# Altium schematic sheet Power.SchDoc
size A3; SheetNumber: 3; SheetTotal: 7
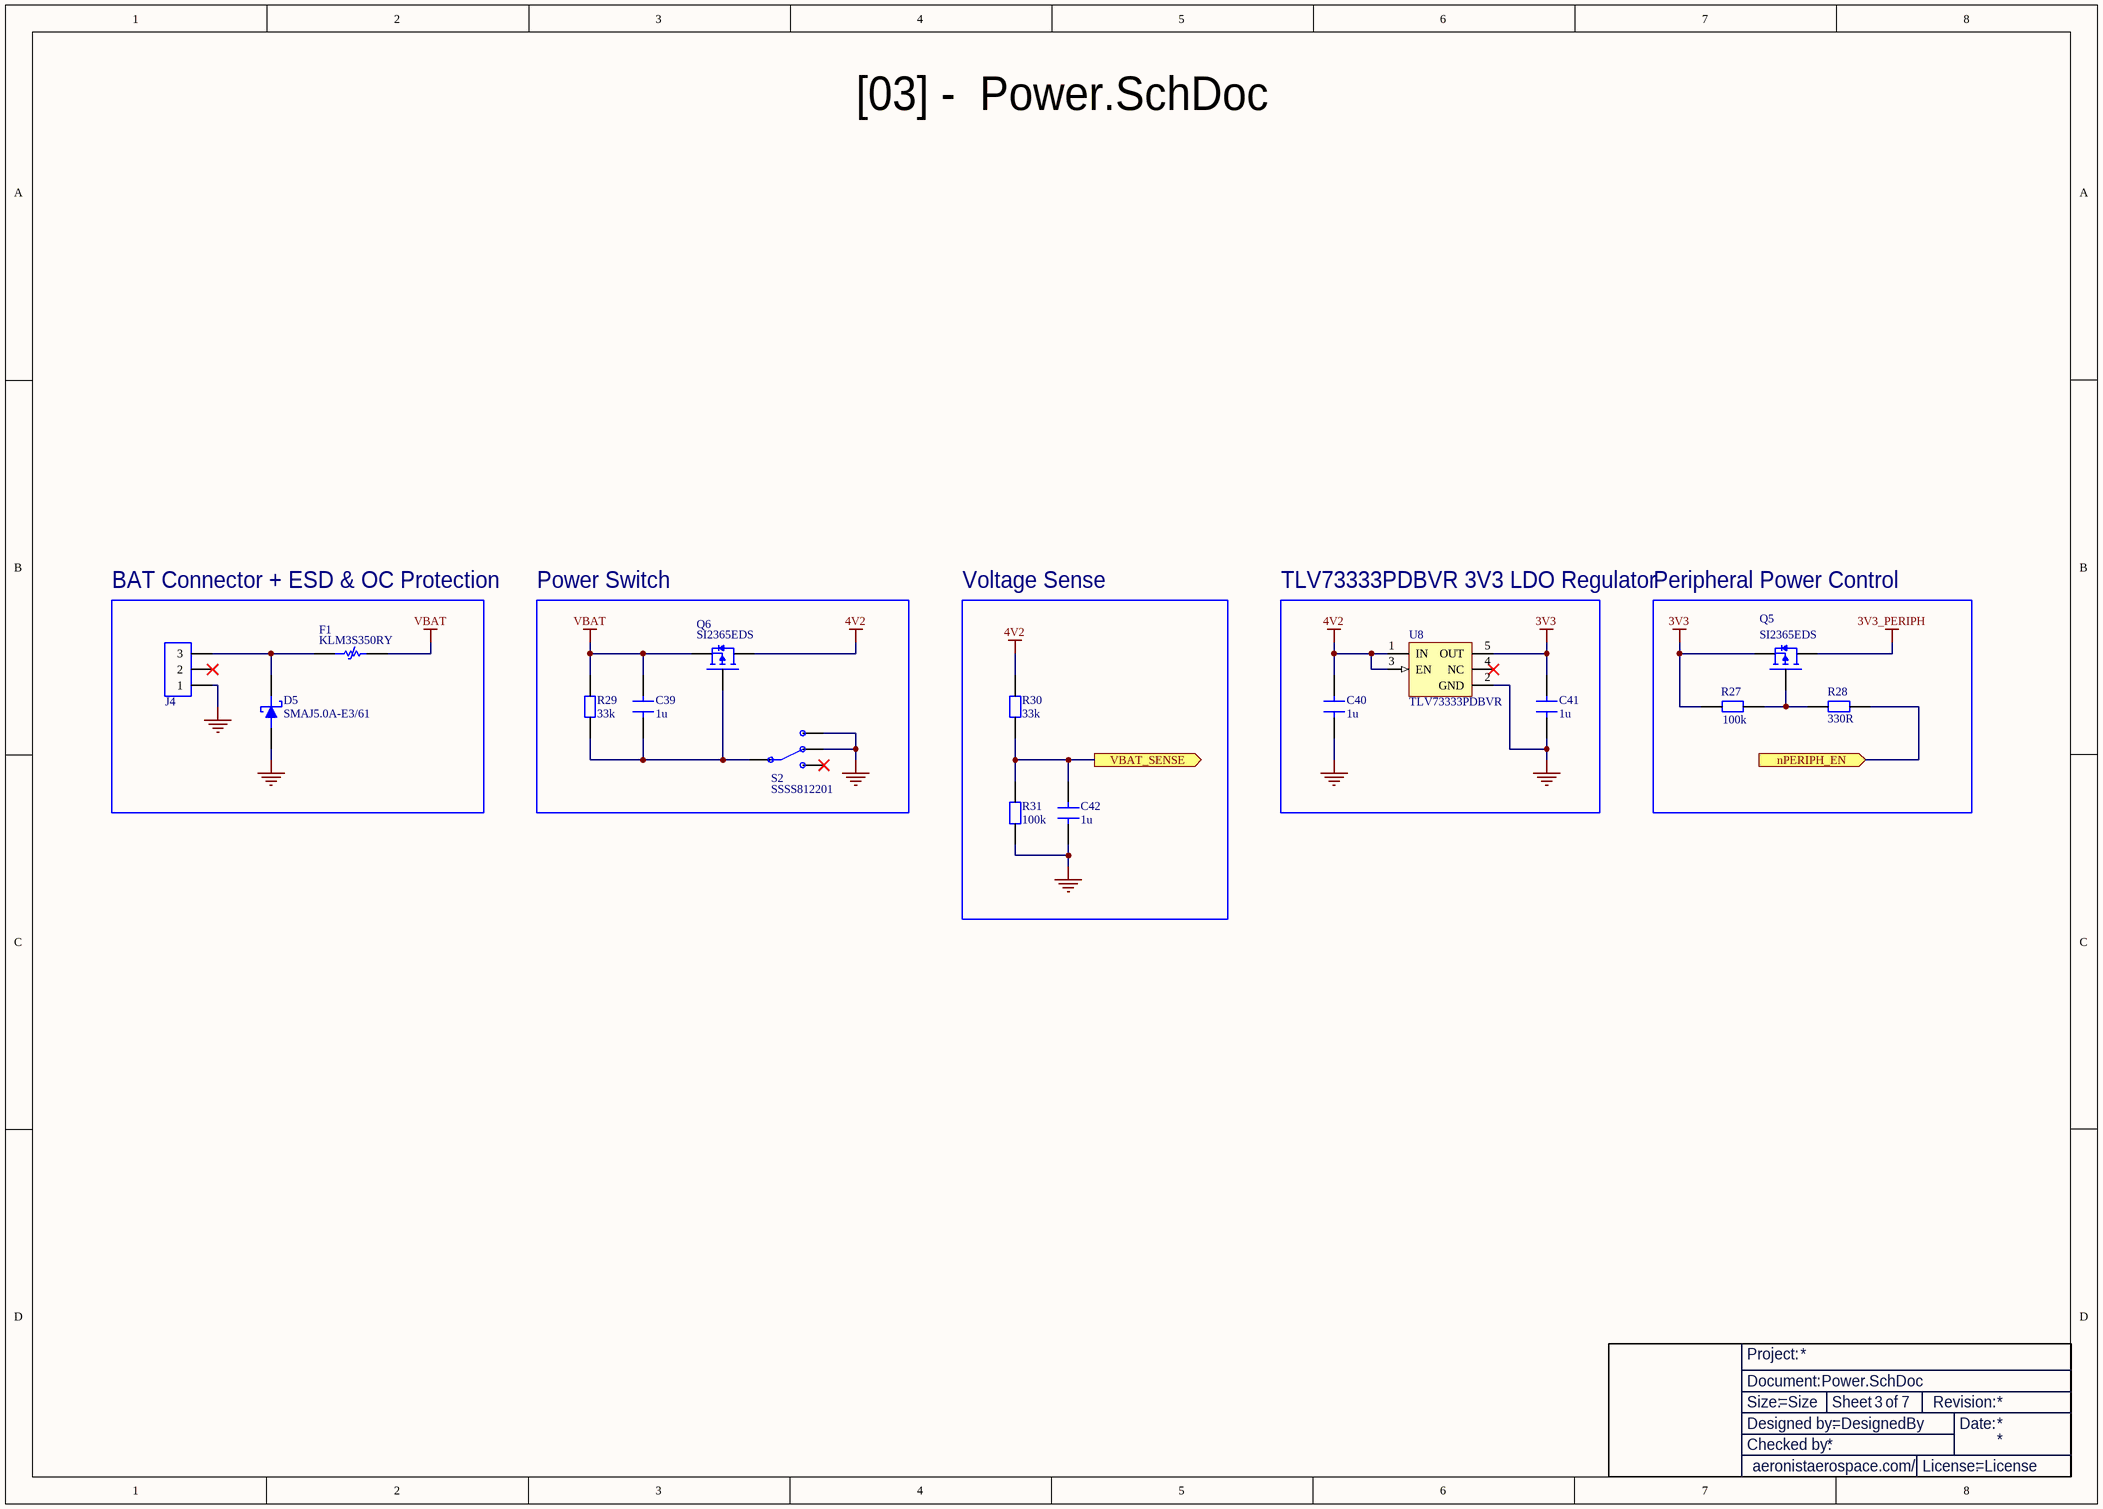
[diagram p0: Power.SchDoc]

## Parts
?  Title Block  (value not drawn)  (graphical)
C39  1u  [CAP 0603]
C40  1u  [CAP 0603]
C41  1u  [CAP 0603]
C42  1u  [CAP 0603]
D5  SMAJ5.0A-E3/61  [SMA]
F1  KLM3S350RY  [PTC 1206]
J4  CONN 1x3 Micro Fit 3.00mm  [CONN 1X3 MICRO-FIT 3.00MM]  (value not drawn)
Q5  SI2365EDS  [SOT23-3]
Q6  SI2365EDS  [SOT23-3]
R27  100k  [RES 0402]
R28  330R  [RES 0402]
R29  33k  [RES 0402]
R30  33k  [RES 0402]
R31  100k  [RES 0402]
S2  SSSS812201  [SSSS812201]
U8  TLV73333PDBVR  [SOT23-5]

## Blocks framed on the sheet
BAT Connector + ESD & OC Protection: D5 F1 J4
Power Switch: C39 Q6 R29 S2
Voltage Sense: C42 R30 R31
TLV73333PDBVR 3V3 LDO Regulator: C40 C41 U8
Peripheral Power Control: Q5 R27 R28

## Ports
nPERIPH_EN (in, see MCU[4B]), VBAT_SENSE (out, see MCU[4C])

## Nets
3V3: C41.2 Q5.2(S) R27.2 U8.5(OUT)
3V3_PERIPH: Q5.3(D)
4V2: C40.2 Q6.3(D) R30.2 U8.1(IN) U8.3(EN)
GND: C40.1 C41.1 C42.1 D5.1 J4.1 R31.1 S2.1(NO) S2.2(NC) U8.2(GND)
VBAT: C39.2 F1.2 Q6.2(S) R29.2
nPERIPH_EN: R28.1 ; port nPERIPH_EN
VBAT_SENSE: C42.2 R30.1 R31.2 ; port VBAT_SENSE
NetC39_1: C39.1 Q6.1(G) R29.1 S2.3(C)
NetD5_2: D5.2 F1.1 J4.3
NetQ5_1: Q5.1(G) R27.1 R28.2

Not connected (* = marked no-connect by the designer): J4 2*; S2 4(NO)*; U8 4(NC)*

## Notes on the sheet
- [03] -  Power.SchDoc
- (in symbol Title Block) Project:; Document:; Size:; Sheet; of; Revision:; Designed by:; Date:; Checked by:; aeronistaerospace.com/; License:

## Library data of the parts
C39-C42 = CAP 0603: Capacitor SMD 0603
D5 = SMAJ-X: SMAJ Series SMT Bi/Uni-Directional Transient Voltage Suppressor - SMA
F1 = PTC 1206: PTC Resettable Fuse; Manufacturer: Bel; Manufacturer Part Number: 0ZCG0075FF2C; Max Current Rating: 100A; Hold Current: 750mA; Trip Current: 1.5A; Time to Trip: 200ms; Supplier 1: Arrow Electronics; RoHS: Yes; Category: PTC Resettable Fuses; Stock 1: 4661; Pricing 1: 2000=0,0751, 4000=0,0699, 6000=0,065, 10000=0,0604 (USD); Mount: Surface Mount; Case/Package: 1812; Case Code (Metric): 4532; Case Code (Imperial): 1812; Contact Plating: Tin,Matte; Min Operating Temperature: -40°C; Max Operating Temperature: 85°C; Packaging: Cut Tape; Series: 0ZCG; Lead Free: Lead Free; RoHS Compliant: Yes; ComponentLink1URL: https://datasheet.ciiva.com/18550/0zcg-18550523.pdf?src-supplier=Digi-Key; ComponentLink1Description: https://datasheet.ciiva.com/18550/0zcg-18550523.pdf?src-supplier=Digi-Key; ComponentLink2URL: https://datasheet.ciiva.com/18550/0zcg-18550524.pdf?src-supplier=Digi-Key; ComponentLink2Description: https://datasheet.ciiva.com/18550/0zcg-18550524.pdf?src-supplier=Digi-Key; ComponentLink3URL: https://datasheet.ciiva.com/18550/0zcg-18550767.pdf?src-supplier=Digi-Key; ComponentLink3Description: https://datasheet.ciiva.com/18550/0zcg-18550767.pdf?src-supplier=Digi-Key
J4 = CONN 1x3 Micro Fit 3.00mm: 1×2 Micro Fit type connector, 3.0 mm pitch, surface-mount.
Q5 Q6 = MOSFET P-CH: SOT-23-3 package, P-Channel MOSFET
R27-R31 = RES 0402: Resistor SMD 0402
S2 = SSSS812201: Slide Switch / Switch Slide SP3T Side Slide 0.3A 5VDC 10000Cycles Gull Wing SMD T/R; Manufacturer: ALPS; Actuator Length: 1.4986mm; Contact Current Rating: 300mA; Contact Resistance: 70mΩ; Electrical Life: 10kcycles; Illumination Type: Non-Illuminated; Insulation Resistance: 100MΩ; Max Voltage Rating (DC): 4V; Number of Positions: 3; Operating Force: 2N; Voltage Rating (DC): 5V; Supplier: Mouser; Supplier Part Number: 688-SSSS812201; Manufacturer Part Number: SSSS812201; RoHS: Compliant; Category: Slide Switches; Stock: 3543; Pricing: 1=1,77, 10=1,6, 50=1,47, 100=1,34, 1000=0,852, 10000=0,851 (USD); Current Rating: 300mA; Depth: 5mm; Export Control Classification Number (ECCN) Code: EAR99; Height: 1.4mm; Harmonized Tariff Schedule (HTS) Code: 8536.50.90.50; Introduction Date: 2010-02-04; Length: 9.7mm; Lifecycle Status: Production; Max Current Rating: 300mA; Max Operating Temperature: 85°C; Mechanical Life: 10kcycles; Min Operating Temperature: -40°C; Mounting Technology: Surface Mount; Pins: 3; Orientation: Right Angle; Radiation Hardening: No; Termination: Gull Wing; Throw Configuration: SP3T; ComponentLink1URL: https://datasheet.octopart.com:443/SSSS812201-ALPS-datasheet-182235029.pdf?src-supplier=IHS; ComponentLink1Description: https://datasheet.octopart.com:443/SSSS812201-ALPS-datasheet-182235029.pdf?src-supplier=IHS; ComponentLink2URL: https://datasheet.octopart.com:443/SSSS812201-ALPS-datasheet-182235643.pdf?src-supplier=IHS; ComponentLink2Description: https://datasheet.octopart.com:443/SSSS812201-ALPS-datasheet-182235643.pdf?src-supplier=IHS; ComponentLink3URL: https://datasheet.octopart.com:443/SSSS812201-ALPS-datasheet-154726925.pdf?src-supplier=Electro+Sonic; ComponentLink3Description: https://datasheet.octopart.com:443/SSSS812201-ALPS-datasheet-154726925.pdf?src-supplier=Electro+Sonic; ComponentLink4URL: https://datasheet.octopart.com:443/SSSS812201-ALPS-datasheet-41175121.pdf?src-supplier=Electro+Sonic; ComponentLink4Description: https://datasheet.octopart.com:443/SSSS812201-ALPS-datasheet-41175121.pdf?src-supplier=Electro+Sonic; ComponentLink5URL: https://datasheet.octopart.com:443/SSSS812201-ALPS-datasheet-37145305.pdf?src-supplier=Electro+Sonic; ComponentLink5Description: https://datasheet.octopart.com:443/SSSS812201-ALPS-datasheet-37145305.pdf?src-supplier=Electro+Sonic; ComponentLink6URL: https://datasheet.octopart.com:443/SSSS812201-ALPS-datasheet-140497758.pdf?src-supplier=TME; ComponentLink6Description: https://datasheet.octopart.com:443/SSSS812201-ALPS-datasheet-140497758.pdf?src-supplier=TME
U8 = TLV73333PDBVR: 300-mA, capacitor-free, low-IQ, low-dropout voltage regulator with enable 5-SOT-23 -40 to 125; Manufacturer: Texas Instruments; Manufacturer Lifecycle Status: ACTIVE; Accuracy: 1%; Dropout Voltage: 125mV; Max Supply Voltage: 5.5V; Max Junction Temperature (Tj): 125°C; Max Output current: 300mA; Min Current Limit: 360mA; Min Input Voltage: 1.4V; Nominal Supply Current: 34µA; Number of Channels: 1; Output Type: Fixed; Output Voltage: 3.3V; Polarity: Positive; Quiescent Current: 60µA; Supplier: Mouser; Supplier Part Number: 595-TLV73333PDBVR; Manufacturer Part Number: TLV73333PDBVR; RoHS: Compliant; Category: LDO Voltage Regulators; Stock: 12067; Pricing: 1=0,17, 10=0,115, 50=0,101, 100=0,086, 1000=0,07, 10000=0,062 (USD); Case/Package: SOT-23; Contact Plating: Gold; Height: 1.45mm; Lead Free: Lead Free; Length: 2.9mm; Lifecycle Status: Production; Max Operating Temperature: 125°C; Min Operating Temperature: -40°C; Min Supply Voltage: 1.4V; Mounting Technology: Surface Mount; Number of Outputs: 1; Pins: 5; Number of Regulators: 1; Output Current: 300mA; Packaging: Tape & Reel; Radiation Hardening: No; Schedule B: 8542390000, 8542390000|8542390000|8542390000|8542390000|8542390000; Thickness: 1.2mm; Weight: 15.790684mg; Width: 1.6mm; ComponentLink1URL: https://sigma.octopart.com:443/177332311/technical_drawing/Texas-Instruments-TLV73333PDBVR.pdf?src-supplier=Texas+Instruments; ComponentLink1Description: https://sigma.octopart.com:443/177332311/technical_drawing/Texas-Instruments-TLV73333PDBVR.pdf?src-supplier=Texas+Instruments; ComponentLink2URL: https://octopart.com:443/opatz8j6/c1?t=30rxbCOKURE0fvLotVHr2--9yC-4hWgg0fjorl7QajC5RXkKBG22M4ZWLOTtqEVkHrkQWGSvUBCT4JzFCKRza57xxEH2AM5zMdrmzUF7HUn0SZ7VrBnq1qaBEhnASKZ9K6cpMGD6K96mHw2RuAXFnqi8r3hf25pr5WVy_93zC9DtrJ2-QNFvwlrZk1EXJAO4qYO9518NXgqDx2DdBm28by8vGuJzgOvU8mXkfRtT8k19nHvP1ZfIaADJPU6FeaqlEbd-j24xmPfxYt-FfVEHWXt0tW1yZYApp5WPtqSvL-aKGKcx1420oXKrzNb7imis-_kE6QqMT633l-x_OdY6nHSWd6_HrFJGfkvfwlphIUbgO9Y3y8pg3cXI5t7uujLqBDPZRvw&src-supplier=Texas+Instruments; ComponentLink2Description: https://octopart.com:443/opatz8j6/c1?t=30rxbCOKURE0fvLotVHr2--9yC-4hWgg0fjorl7QajC5RXkKBG22M4ZWLOTtqEVkHrkQWGSvUBCT4JzFCKRza57xxEH2AM5zMdrmzUF7HUn0SZ7VrBnq1qaBEhnASKZ9K6cpMGD6K96mHw2RuAXFnqi8r3hf25pr5WVy_93zC9DtrJ2-QNFvwlrZk1EXJAO4qYO9518NXgqDx2DdBm28by8vGuJzgOvU8mXkfRtT8k19nHvP1ZfIaADJPU6FeaqlEbd-j24xmPfxYt-FfVEHWXt0tW1yZYApp5WPtqSvL-aKGKcx1420oXKrzNb7imis-_kE6QqMT633l-x_OdY6nHSWd6_HrFJGfkvfwlphIUbgO9Y3y8pg3cXI5t7uujLqBDPZRvw&src-supplier=Texas+Instruments; ComponentLink3URL: https://sigma.octopart.com:443/175570406/technical_drawing/Texas-Instruments-TLV73333PDBVR.pdf?src-supplier=Texas+Instruments; ComponentLink3Description: https://sigma.octopart.com:443/175570406/technical_drawing/Texas-Instruments-TLV73333PDBVR.pdf?src-supplier=Texas+Instruments; ComponentLink4URL: https://sigma.octopart.com:443/169406034/technical_drawing/Texas-Instruments-TLV73333PDBVR.pdf?src-supplier=Texas+Instruments; ComponentLink4Description: https://sigma.octopart.com:443/169406034/technical_drawing/Texas-Instruments-TLV73333PDBVR.pdf?src-supplier=Texas+Instruments; ComponentLink5URL: https://sigma.octopart.com:443/155939316/technical_drawing/Texas-Instruments-TLV73333PDBVR.pdf?src-supplier=Texas+Instruments; ComponentLink5Description: https://sigma.octopart.com:443/155939316/technical_drawing/Texas-Instruments-TLV73333PDBVR.pdf?src-supplier=Texas+Instruments; ComponentLink6URL: https://sigma.octopart.com:443/102331370/technical_drawing/Texas-Instruments-TLV73333PDBVR.pdf?src-supplier=Texas+Instruments; ComponentLink6Description: https://sigma.octopart.com:443/102331370/technical_drawing/Texas-Instruments-TLV73333PDBVR.pdf?src-supplier=Texas+Instruments; ComponentLink7URL: https://datasheet.octopart.com:443/TLV73333PDBVR-Texas-Instruments-datasheet-37736395.pdf?src-supplier=Texas+Instruments; ComponentLink7Description: https://datasheet.octopart.com:443/TLV73333PDBVR-Texas-Instruments-datasheet-37736395.pdf?src-supplier=Texas+Instruments; ComponentLink8URL: https://datasheet.octopart.com:443/TLV73333PDBVR-Texas-Instruments-datasheet-34151877.pdf?src-supplier=Texas+Instruments; ComponentLink8Description: https://datasheet.octopart.com:443/TLV73333PDBVR-Texas-Instruments-datasheet-34151877.pdf?src-supplier=Texas+Instruments; ComponentLink9URL: https://sigma.octopart.com:443/49249325/technical_drawing/Texas-Instruments-TLV73333PDBVR.pdf?src-supplier=Texas+Instruments; ComponentLink9Description: https://sigma.octopart.com:443/49249325/technical_drawing/Texas-Instruments-TLV73333PDBVR.pdf?src-supplier=Texas+Instruments; ComponentLink10URL: https://datasheet.octopart.com:443/TLV73333PDBVR-Texas-Instruments-datasheet-32043788.pdf?src-supplier=Texas+Instruments; ComponentLink10Description: https://datasheet.octopart.com:443/TLV73333PDBVR-Texas-Instruments-datasheet-32043788.pdf?src-supplier=Texas+Instruments; ComponentLink11URL: https://datasheet.octopart.com:443/TLV73333PDBVR-Texas-Instruments-datasheet-159114894.pdf?src-supplier=Augswan; ComponentLink11Description: https://datasheet.octopart.com:443/TLV73333PDBVR-Texas-Instruments-datasheet-159114894.pdf?src-supplier=Augswan; ComponentLink12URL: https://datasheet.octopart.com:443/TLV73333PDBVR-Texas-Instruments-datasheet-159117831.pdf?src-supplier=LCSC; ComponentLink12Description: https://datasheet.octopart.com:443/TLV73333PDBVR-Texas-Instruments-datasheet-159117831.pdf?src-supplier=LCSC; ComponentLink13URL: http://sigma.octopart.com:80/conflict_mineral_statement/Texas-Instruments-company-63.pdf?src-supplier=Compliance+Statements; ComponentLink13Description: http://sigma.octopart.com:80/conflict_mineral_statement/Texas-Instruments-company-63.pdf?src-supplier=Compliance+Statements; ComponentLink14URL: http://sigma.octopart.com:80/reach_statement/Texas-Instruments-company-64.pdf?src-supplier=Compliance+Statements; ComponentLink14Description: http://sigma.octopart.com:80/reach_statement/Texas-Instruments-company-64.pdf?src-supplier=Compliance+Statements